# Altium schematic sheet P1.schdoc
size 594 x 421 mm; Symbol: Sheet-Symbol_A4; Company: 嘉立创EDA; Version: V1.0; Page Size: A2; @Project Name: 基于裕太微YT9215S的五口千兆交换机; @Page Count: 2; @Update Date: 2023-09-12; @Create Date: 2023-09-12; @Schematic Name: schematic1; @Page No: 1; @Page Name: P1; Device: Sheet-Symbol_A4
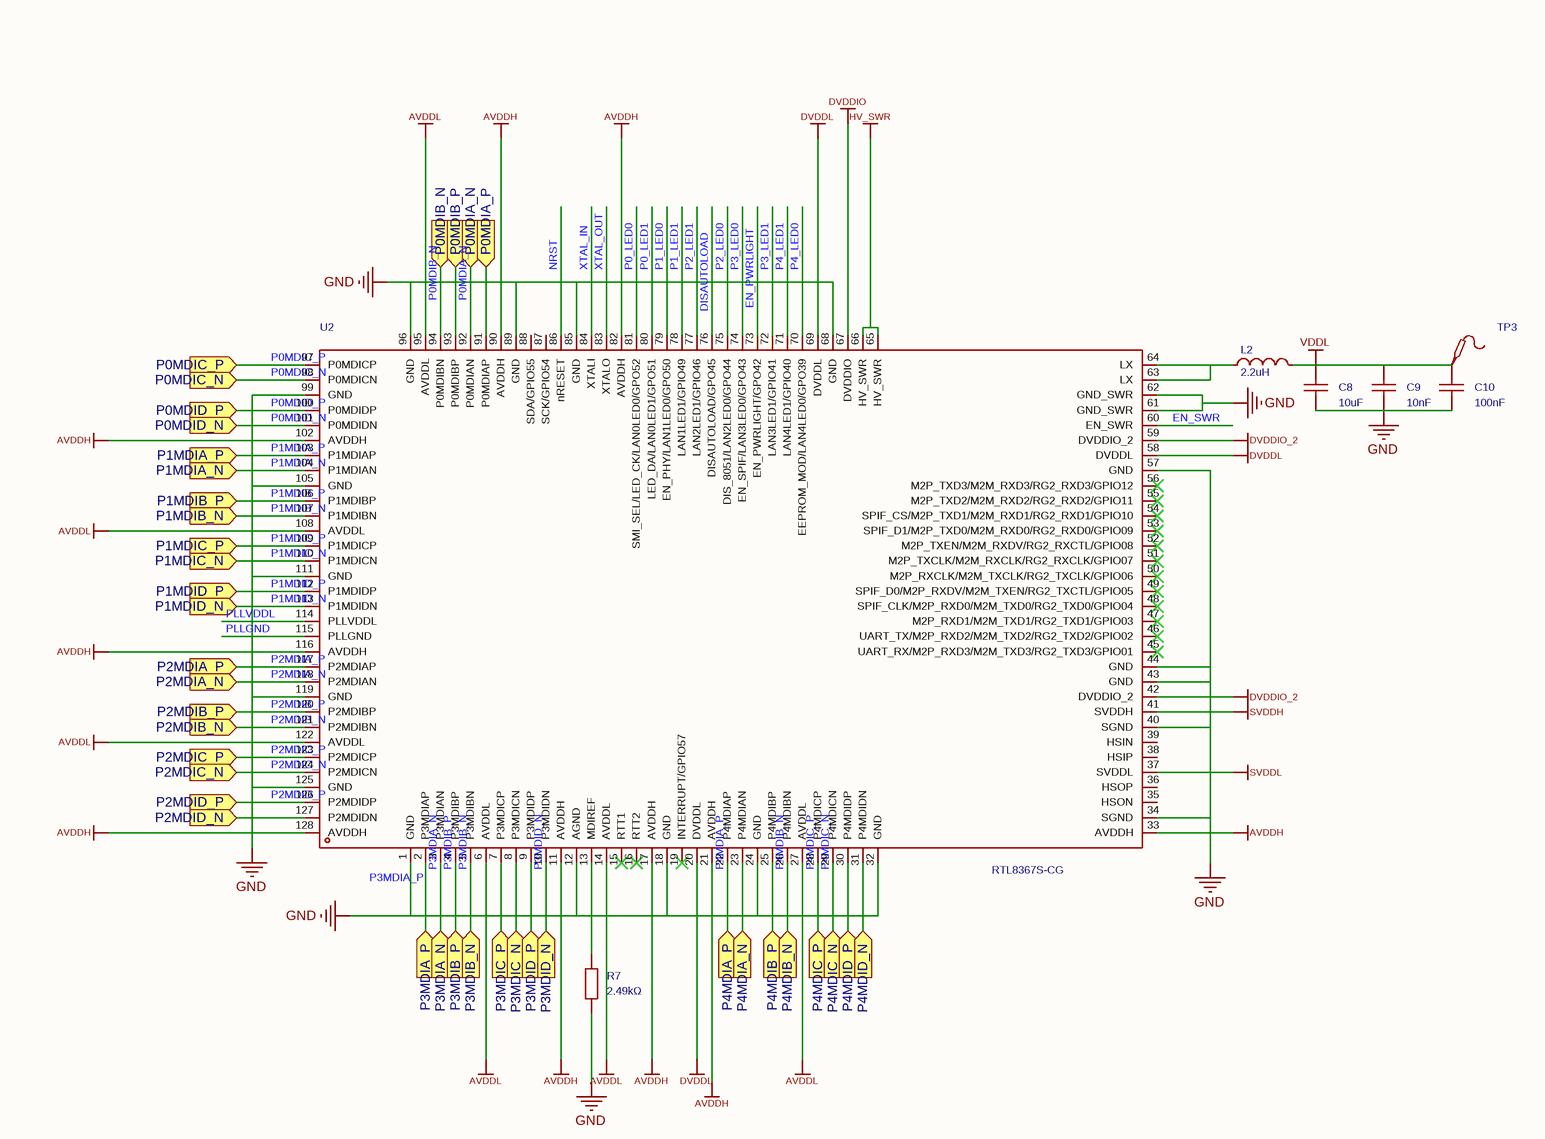
[diagram p0: P1.schdoc, top left]
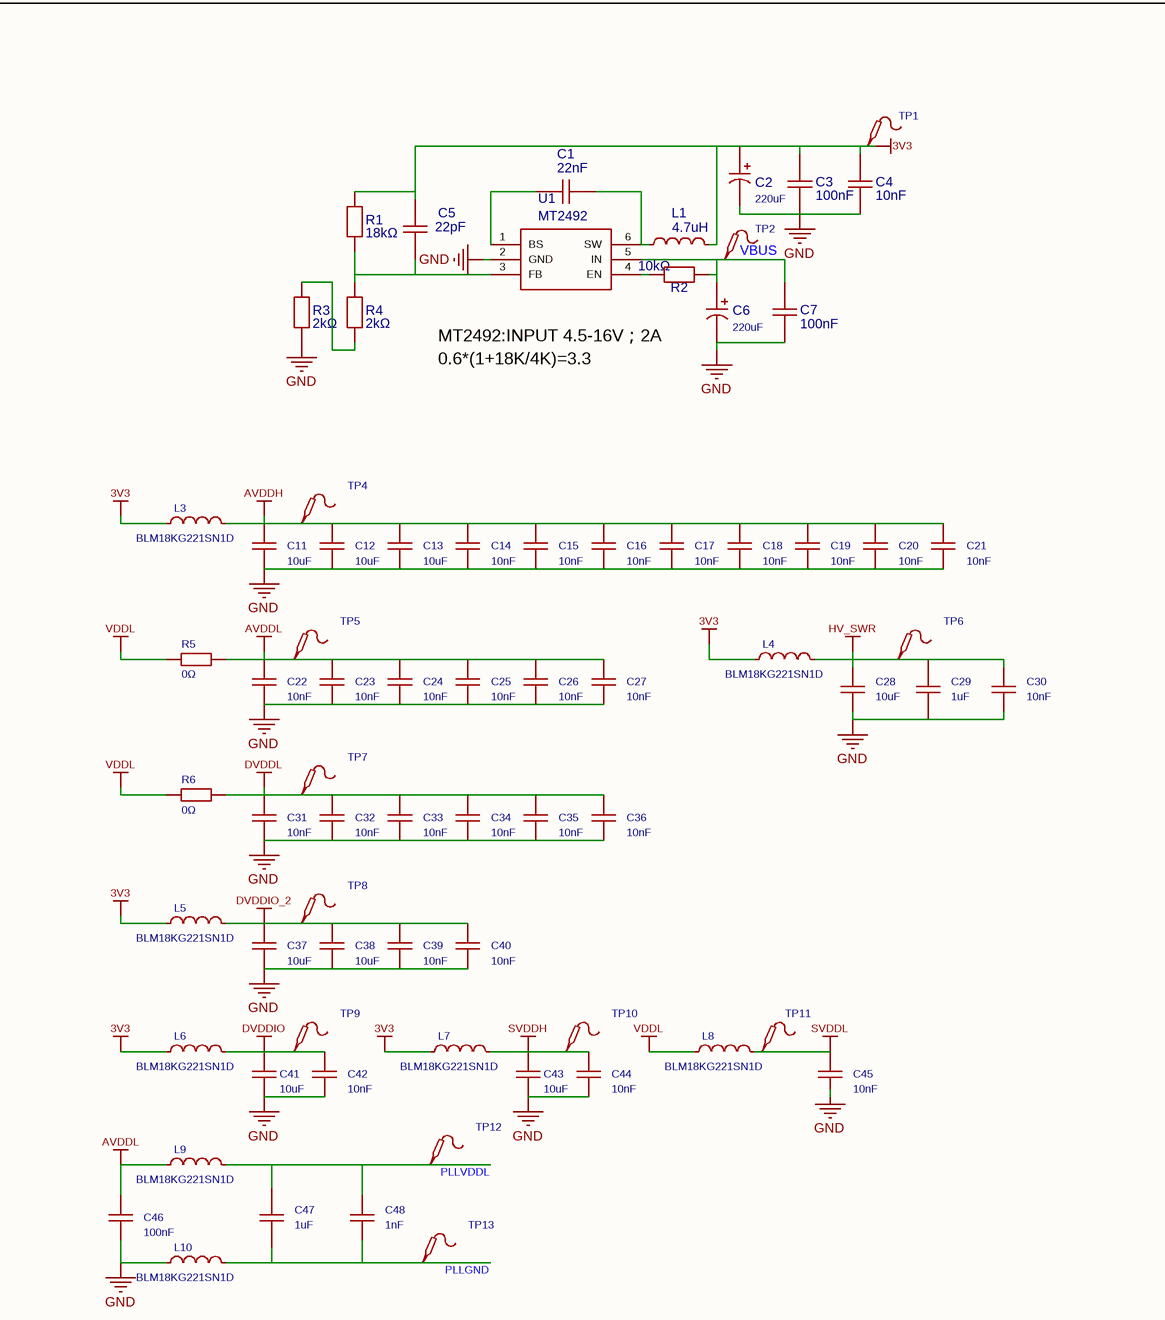
[diagram p1: P1.schdoc, top right]
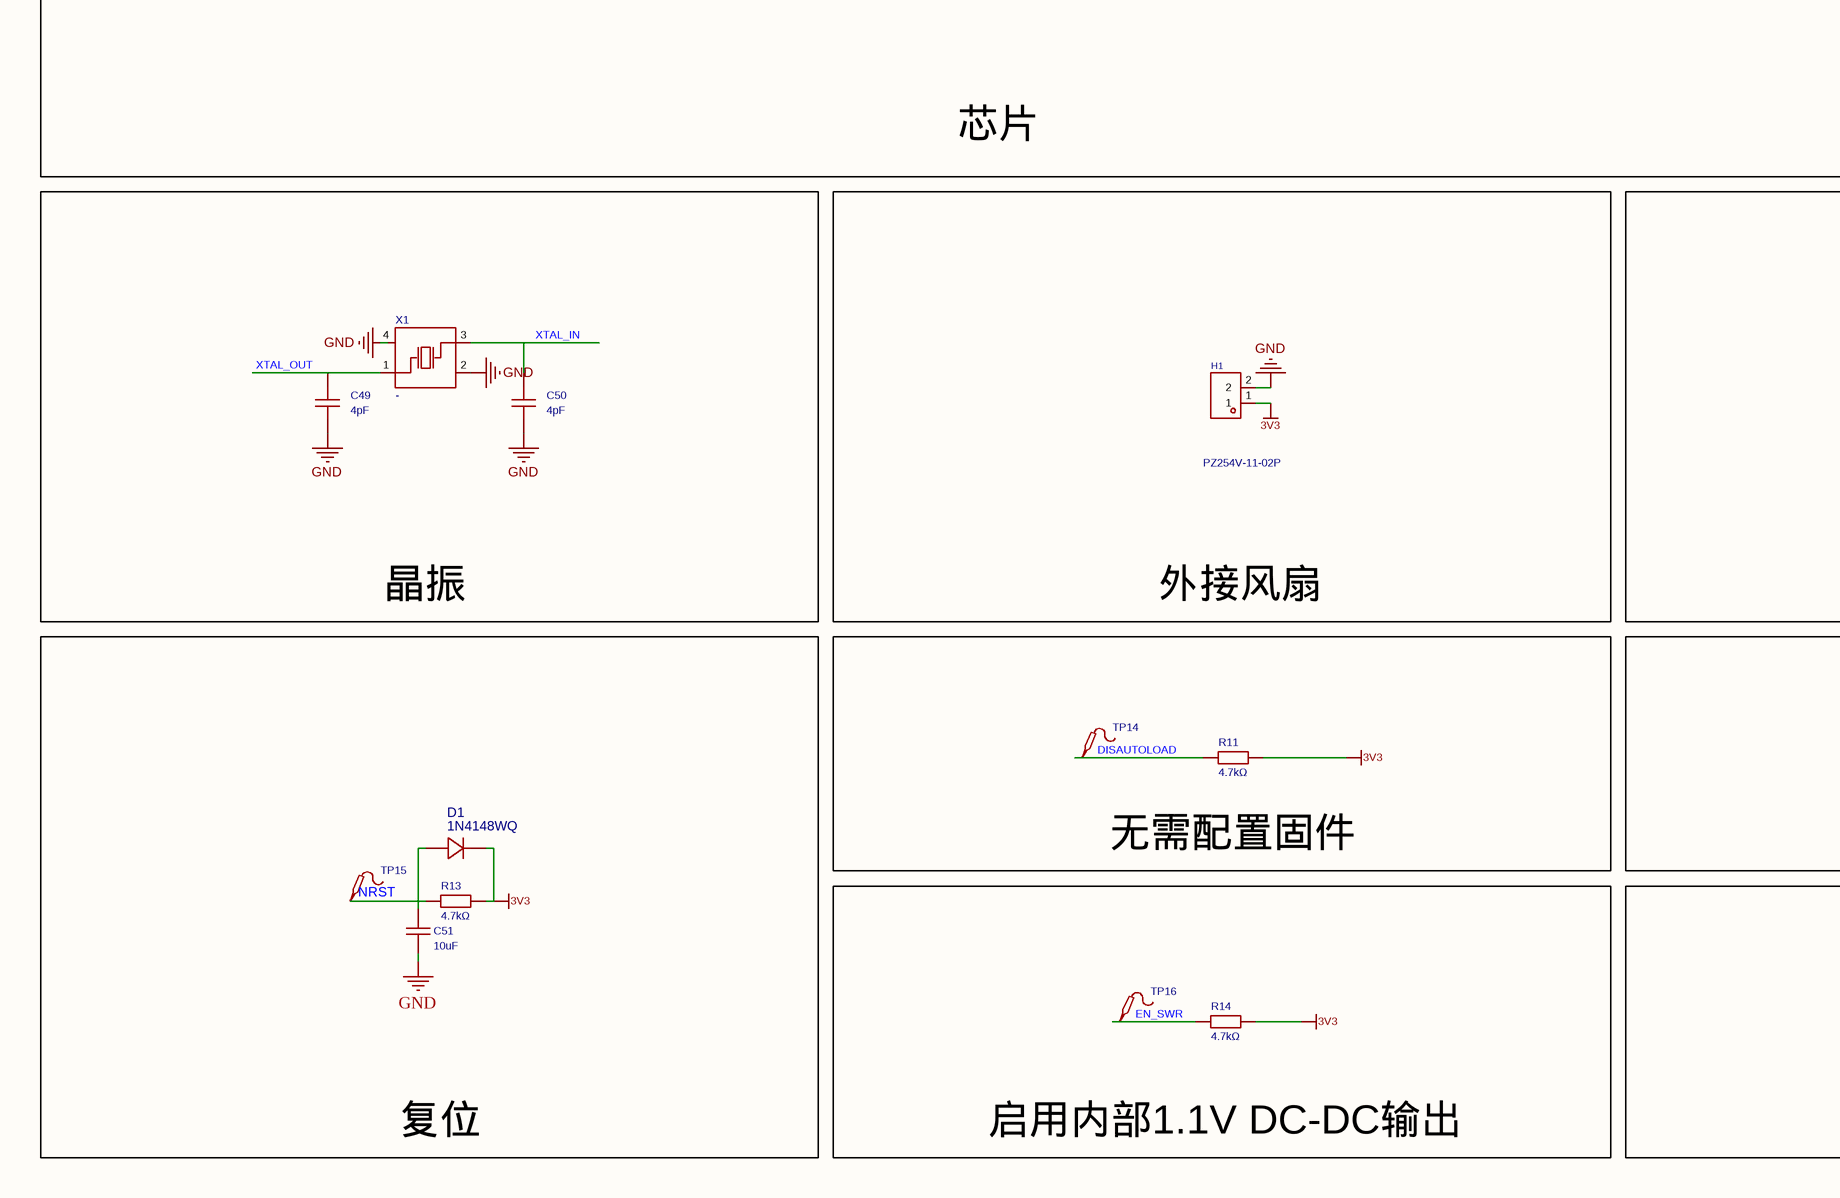
[diagram p2: P1.schdoc, bottom left]
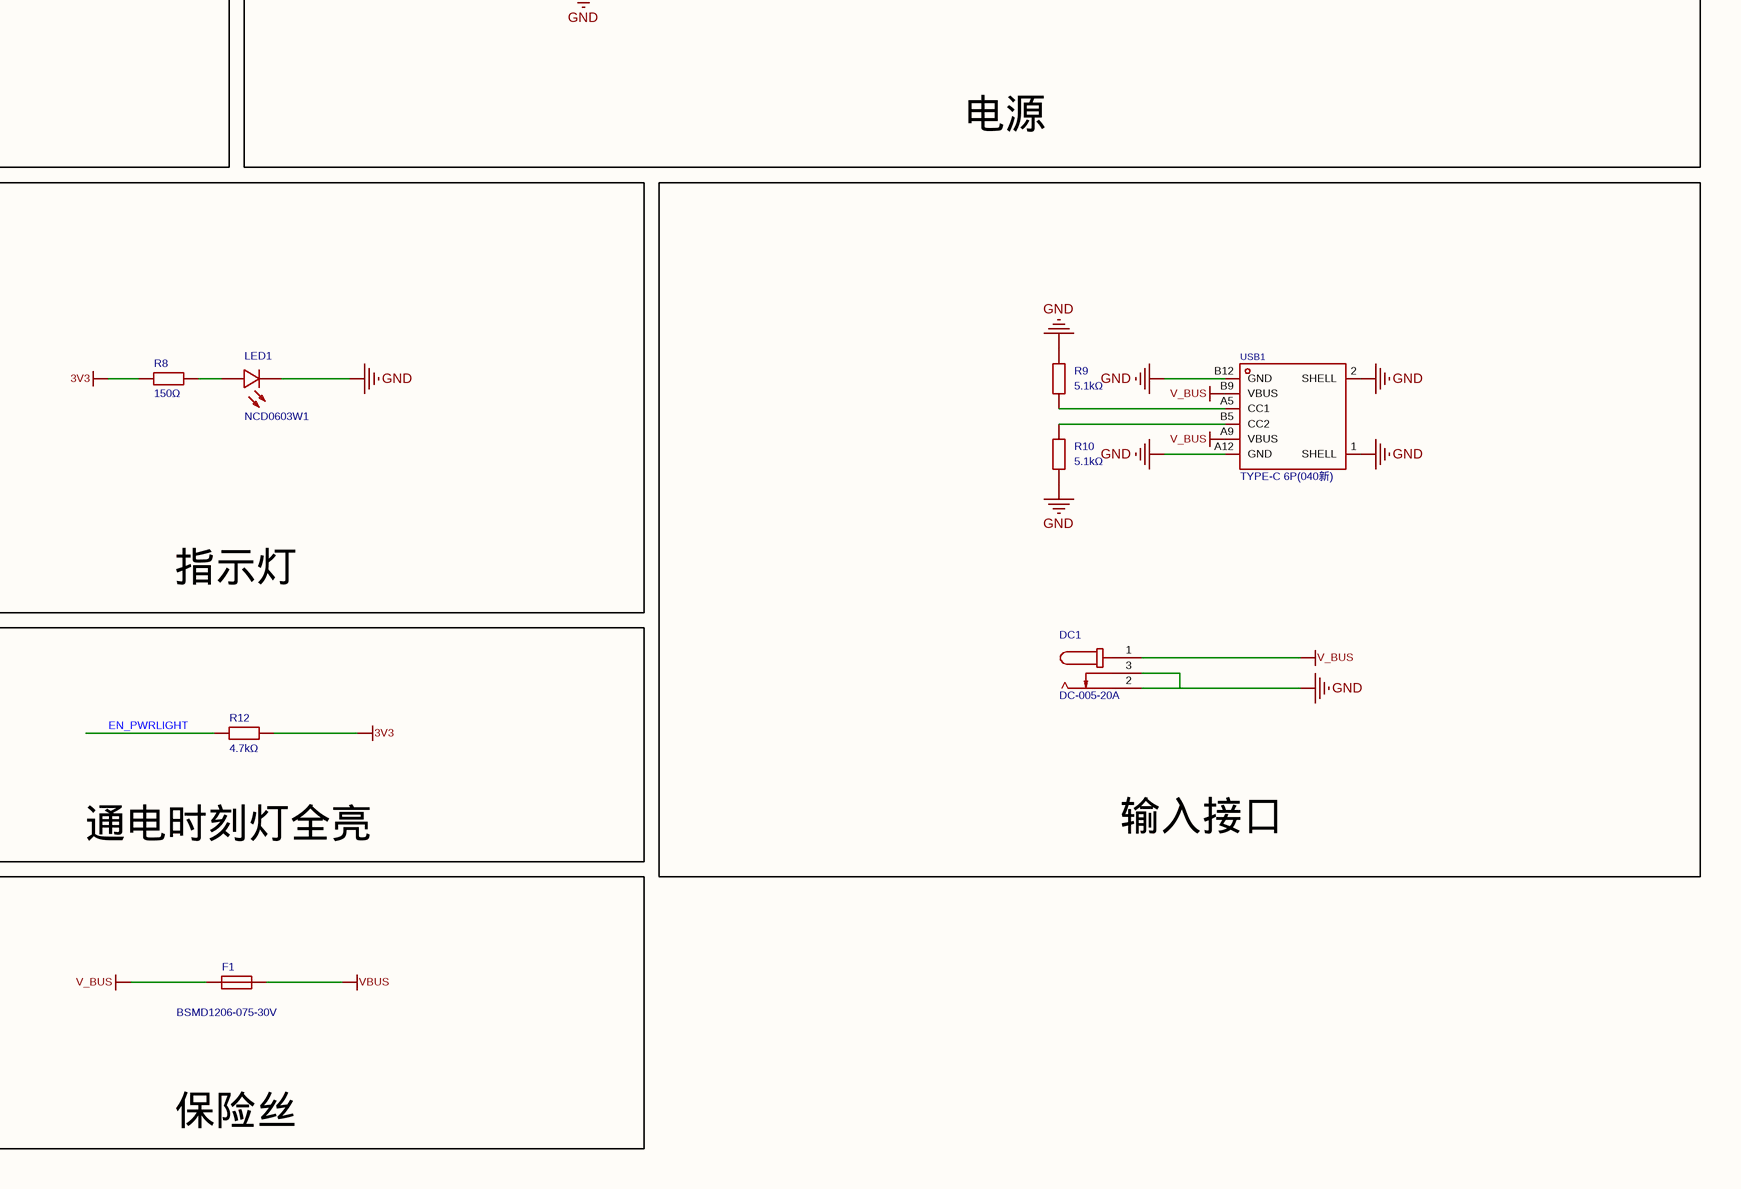
[diagram p3: P1.schdoc, bottom right]

## Parts
C1  22nF  [C0402]
C2  220uF  [CAP-SMD_BD6.3-L6.6-W6.6-LS7.4-FD]
C3  100nF  [C0402]
C4  10nF  [C0402]
C5  22pF  [C0402]
C6  220uF  [CAP-SMD_BD6.3-L6.6-W6.6-LS7.4-FD]
C7  100nF  [C0402]
C8  10uF  [C0805]
C9  10nF  [C0603]
C10  100nF  [C0603]
C11  10uF  [C0805]
C12  10uF  [C0805]
C13  10uF  [C0805]
C14  10nF  [C0603]
C15  10nF  [C0603]
C16  10nF  [C0603]
C17  10nF  [C0603]
C18  10nF  [C0603]
C19  10nF  [C0603]
C20  10nF  [C0603]
C21  10nF  [C0603]
C22  10nF  [C0603]
C23  10nF  [C0603]
C24  10nF  [C0603]
C25  10nF  [C0603]
C26  10nF  [C0603]
C27  10nF  [C0603]
C28  10uF  [C0805]
C29  1uF  [C0603]
C30  10nF  [C0603]
C31  10nF  [C0603]
C32  10nF  [C0603]
C33  10nF  [C0603]
C34  10nF  [C0603]
C35  10nF  [C0603]
C36  10nF  [C0603]
C37  10uF  [C0805]
C38  10uF  [C0805]
C39  10nF  [C0603]
C40  10nF  [C0603]
C41  10uF  [C0805]
C42  10nF  [C0603]
C43  10uF  [C0805]
C44  10nF  [C0603]
C45  10nF  [C0603]
C46  100nF  [C0603]
C47  1uF  [C0603]
C48  1nF  [C0603]
C49  4pF  [C0603]
C50  4pF  [C0603]
C51  10uF  [C0805]
D1  1N4148WQ  [SOD-123_L2.7-W1.6-LS3.7-RD-1]
DC1  DC-005-20A  [DC-IN-TH_DC-005-20A]
F1  BSMD1206-075-30V  [F1206]
H1  PZ254V-11-02P  [HDR-TH_2P-P2.54-V-M]
L1  4.7uH  [IND-SMD_L4.0-W4.0]
L2  2.2uH  [IND-SMD_L4.0-W4.0_SWPA4018S]
L3  BLM18KG221SN1D  [L0603]
L4  BLM18KG221SN1D  [L0603]
L5  BLM18KG221SN1D  [L0603]
L6  BLM18KG221SN1D  [L0603]
L7  BLM18KG221SN1D  [L0603]
L8  BLM18KG221SN1D  [L0603]
L9  BLM18KG221SN1D  [L0603]
L10  BLM18KG221SN1D  [L0603]
LED1  NCD0603W1  [LED0603-RD]
R1  18kΩ  [R0402]
R2  10kΩ  [R0402]
R3  2kΩ  [R0402]
R4  2kΩ  [R0402]
R5  0Ω  [R1206]
R6  0Ω  [R1206]
R7  2.49kΩ  [R0402]
R8  150Ω  [R0603]
R9  5.1kΩ  [R0603]
R10  5.1kΩ  [R0603]
R11  4.7kΩ  [R0603]
R12  4.7kΩ  [R0603]
R13  4.7kΩ  [R0603]
R14  4.7kΩ  [R0603]
TP1  (no value)  [Test-Point-0.5mm]
TP2  (no value)  [Test-Point-0.5mm]
TP3  (no value)  [Test-Point-0.5mm]
TP4  (no value)  [Test-Point-0.5mm]
TP5  (no value)  [Test-Point-0.5mm]
TP6  (no value)  [Test-Point-0.5mm]
TP7  (no value)  [Test-Point-0.5mm]
TP8  (no value)  [Test-Point-0.5mm]
TP9  (no value)  [Test-Point-0.5mm]
TP10  (no value)  [Test-Point-0.5mm]
TP11  (no value)  [Test-Point-0.5mm]
TP12  (no value)  [Test-Point-0.5mm]
TP13  (no value)  [Test-Point-0.5mm]
TP14  (no value)  [Test-Point-0.5mm]
TP15  (no value)  [Test-Point-0.5mm]
TP16  (no value)  [Test-Point-0.5mm]
U1  MT2492  [SOT-23-6_L2.9-W1.6-P0.95-LS2.8-BL]
U2  RTL8367S-CG  [LQFP-128_L14.0-W14.0-P0.40-LS16.0-BL]
USB1  TYPE-C 6P(040新)  [USB-C-SMD_TYPE-C-6P]
X1  -  [CRYSTAL-SMD_4P-L2.0-W1.6-BL]

## Blocks framed on the sheet
芯片: C8-C10 L2 R7 TP3 U2
电源: C1-C7 C11-C48 L1 L3-L10 R1-R6 TP1 TP2 TP4-TP13 U1
晶振: C49 C50 X1
外接风扇: H1
指示灯: LED1 R8
输入接口: DC1 R9 R10 USB1
复位: C51 D1 R13 TP15
无需配置固件: R11 TP14
通电时刻灯全亮: R12
启用内部1.1V DC-DC输出: R14 TP16
保险丝: F1

## Ports
P0MDIA_N (in), P0MDIA_P (in), P0MDIB_N (in), P0MDIB_P (in), P0MDIC_N (in), P0MDIC_P (in), P0MDID_N (in), P0MDID_P (in), P1MDIA_N (in), P1MDIA_P (in), P1MDIB_N (in), P1MDIB_P (in), P1MDIC_N (in), P1MDIC_P (in), P1MDID_N (in), P1MDID_P (in), P2MDIA_N (in), P2MDIA_P (in), P2MDIB_N (in), P2MDIB_P (in), P2MDIC_N (in), P2MDIC_P (in), P2MDID_N (in), P2MDID_P (in), P3MDIA_N (in), P3MDIA_P (in), P3MDIB_N (in), P3MDIB_P (in), P3MDIC_N (in), P3MDIC_P (in), P3MDID_N (in), P3MDID_P (in), P4MDIA_N (in), P4MDIA_P (in), P4MDIB_N (in), P4MDIB_P (in), P4MDIC_N (in), P4MDIC_P (in), P4MDID_N (in), P4MDID_P (in)

## Nets
3V3: C2.1 C3.2 C4.2 C5.1 D1.1(K) H1.1 L1.2 L3.1 L4.1 L5.1 L6.1 L7.1 R1.1 R8.1 R11.2 R12.2 R13.2 R14.2 TP1.1
AVDDH: C11.2 C12.2 C13.2 C14.2 C15.2 C16.2 C17.2 C18.2 C19.2 C20.2 C21.2 L3.2 TP4.1 U2.11(AVDDH) U2.17(AVDDH) U2.21(AVDDH) U2.33(AVDDH) U2.82(AVDDH) U2.90(AVDDH) U2.102(AVDDH) U2.116(AVDDH) U2.128(AVDDH)
AVDDL: C22.2 C23.2 C24.2 C25.2 C26.2 C27.2 C46.2 L9.1 R5.2 TP5.1 U2.6(AVDDL) U2.14(AVDDL) U2.27(AVDDL) U2.95(AVDDL) U2.108(AVDDL) U2.122(AVDDL)
DVDDIO: C41.2 C42.2 L6.2 TP9.1 U2.67(DVDDIO)
DVDDIO_2: C37.2 C38.2 C39.2 C40.2 L5.2 TP8.1 U2.42(DVDDIO_2) U2.59(DVDDIO_2)
DVDDL: C31.2 C32.2 C33.2 C34.2 C35.2 C36.2 R6.2 TP7.1 U2.20(DVDDL) U2.58(DVDDL) U2.69(DVDDL)
GND: C2.2 C3.1 C4.1 C6.2 C7.1 C8.1 C9.1 C10.1 C11.1 C12.1 C13.1 C14.1 C15.1 C16.1 C17.1 C18.1 C19.1 C20.1 C21.1 C22.1 C23.1 C24.1 C25.1 C26.1 C27.1 C28.1 C29.1 C30.1 C31.1 C32.1 C33.1 C34.1 C35.1 C36.1 C37.1 C38.1 C39.1 C40.1 C41.1 C42.1 C43.1 C44.1 C45.1 C46.1 C49.1 C50.1 C51.1 DC1.2 DC1.3 H1.2 L10.1 LED1.1(-) R3.2 R7.1 R9.2 R10.1 U1.2(GND) U2.1(GND) U2.12(AGND) U2.18(GND) U2.24(GND) U2.32(GND) U2.34(SGND) U2.40(SGND) U2.43(GND) U2.44(GND) U2.57(GND) U2.61(GND_SWR) U2.62(GND_SWR) U2.68(GND) U2.85(GND) U2.89(GND) U2.96(GND) U2.99(GND) U2.105(GND) U2.111(GND) U2.119(GND) U2.125(GND) USB1.1(SHELL) USB1.2(SHELL) USB1.A12(GND) USB1.B12(GND) X1.2(GND) X1.4(GND)
HV_SWR: C28.2 C29.2 C30.2 L4.2 TP6.1 U2.65(HV_SWR) U2.66(HV_SWR)
SVDDH: C43.2 C44.2 L7.2 TP10.1 U2.41(SVDDH)
SVDDL: C45.2 L8.2 TP11.1 U2.37(SVDDL)
V_BUS: DC1.1 F1.1 USB1.A9(VBUS) USB1.B9(VBUS)
VBUS: C6.1 C7.2 F1.2 R2.1 TP2.1 U1.5(IN)
VDDL: C8.2 C9.2 C10.2 L2.2 L8.1 R5.1 R6.1 TP3.1
DISAUTOLOAD: R11.1 TP14.1 U2.76(DISAUTOLOAD/GPO45)
EN_PWRLIGHT: R12.1 U2.73(EN_PWRLIGHT/GPO42)
EN_SWR: R14.1 TP16.1 U2.60(EN_SWR)
NRST: C51.2 D1.2(A) R13.1 TP15.1 U2.86(nRESET)
P0_LED0: U2.81(SMI_SEL/LED_CK/LAN0LED0/GPO52)
P0_LED1: U2.80(LED_DA/LAN0LED1/GPO51)
P0MDIA_N: U2.92(P0MDIAN) ; port P0MDIA_N
P0MDIA_P: U2.91(P0MDIAP) ; port P0MDIA_P
P0MDIB_N: U2.94(P0MDIBN) ; port P0MDIB_N
P0MDIB_P: U2.93(P0MDIBP) ; port P0MDIB_P
P0MDIC_N: U2.98(P0MDICN) ; port P0MDIC_N
P0MDIC_P: U2.97(P0MDICP) ; port P0MDIC_P
P0MDID_N: U2.101(P0MDIDN) ; port P0MDID_N
P0MDID_P: U2.100(P0MDIDP) ; port P0MDID_P
P1_LED0: U2.79(EN_PHY/LAN1LED0/GPO50)
P1_LED1: U2.78(LAN1LED1/GPIO49)
P1MDIA_N: U2.104(P1MDIAN) ; port P1MDIA_N
P1MDIA_P: U2.103(P1MDIAP) ; port P1MDIA_P
P1MDIB_N: U2.107(P1MDIBN) ; port P1MDIB_N
P1MDIB_P: U2.106(P1MDIBP) ; port P1MDIB_P
P1MDIC_N: U2.110(P1MDICN) ; port P1MDIC_N
P1MDIC_P: U2.109(P1MDICP) ; port P1MDIC_P
P1MDID_N: U2.113(P1MDIDN) ; port P1MDID_N
P1MDID_P: U2.112(P1MDIDP) ; port P1MDID_P
P2_LED0: U2.75(DIS_8051/LAN2LED0/GPO44)
P2_LED1: U2.77(LAN2LED1/GPIO46)
P2MDIA_N: U2.118(P2MDIAN) ; port P2MDIA_N
P2MDIA_P: U2.117(P2MDIAP) ; port P2MDIA_P
P2MDIB_N: U2.121(P2MDIBN) ; port P2MDIB_N
P2MDIB_P: U2.120(P2MDIBP) ; port P2MDIB_P
P2MDIC_N: U2.124(P2MDICN) ; port P2MDIC_N
P2MDIC_P: U2.123(P2MDICP) ; port P2MDIC_P
P2MDID_N: U2.127(P2MDIDN) ; port P2MDID_N
P2MDID_P: U2.126(P2MDIDP) ; port P2MDID_P
P3_LED0: U2.74(EN_SPIF/LAN3LED0/GPO43)
P3_LED1: U2.72(LAN3LED1/GPIO41)
P3MDIA_N: U2.3(P3MDIAN) ; port P3MDIA_N
P3MDIA_P: U2.2(P3MDIAP) ; port P3MDIA_P
P3MDIB_N: U2.5(P3MDIBN) ; port P3MDIB_N
P3MDIB_P: U2.4(P3MDIBP) ; port P3MDIB_P
P3MDIC_N: U2.8(P3MDICN) ; port P3MDIC_N
P3MDIC_P: U2.7(P3MDICP) ; port P3MDIC_P
P3MDID_N: U2.10(P3MDIDN) ; port P3MDID_N
P3MDID_P: U2.9(P3MDIDP) ; port P3MDID_P
P4_LED0: U2.70(EEPROM_MOD/LAN4LED0/GPO39)
P4_LED1: U2.71(LAN4LED1/GPIO40)
P4MDIA_N: U2.23(P4MDIAN) ; port P4MDIA_N
P4MDIA_P: U2.22(P4MDIAP) ; port P4MDIA_P
P4MDIB_N: U2.26(P4MDIBN) ; port P4MDIB_N
P4MDIB_P: U2.25(P4MDIBP) ; port P4MDIB_P
P4MDIC_N: U2.29(P4MDICN) ; port P4MDIC_N
P4MDIC_P: U2.28(P4MDICP) ; port P4MDIC_P
P4MDID_N: U2.31(P4MDIDN) ; port P4MDID_N
P4MDID_P: U2.30(P4MDIDP) ; port P4MDID_P
PLLGND: C47.1 C48.1 L10.2 TP13.1 U2.115(PLLGND)
PLLVDDL: C47.2 C48.2 L9.2 TP12.1 U2.114(PLLVDDL)
XTAL_IN: C50.2 U2.84(XTALI) X1.3(OSC2)
XTAL_OUT: C49.2 U2.83(XTALO) X1.1(OSC1)
NetC1_1: C1.1 U1.1(BS)
NetC1_2: C1.2 L1.1 U1.6(SW)
NetC5_2: C5.2 R1.2 R4.1 U1.3(FB)
NetL2_1: L2.1 U2.63(LX) U2.64(LX)
NetLED1_2: LED1.2(+) R8.2
NetR2_2: R2.2 U1.4(EN)
NetR3_1: R3.1 R4.2
NetR7_2: R7.2 U2.13(MDIREF)
NetR9_1: R9.1 USB1.A5(CC1)
NetR10_2: R10.2 USB1.B5(CC2)

Not connected (* = marked no-connect by the designer): U2 15(RTT1)* 16(RTT2)* 19(INTERRUPT/GPIO57)* 35(HSON) 36(HSOP) 38(HSIP) 39(HSIN) 45(UART_RX/M2P_RXD3/M2M_TXD3/RG2_TXD3/GPIO01)* 46(UART_TX/M2P_RXD2/M2M_TXD2/RG2_TXD2/GPIO02)* 47(M2P_RXD1/M2M_TXD1/RG2_TXD1/GPIO03)* 48(SPIF_CLK/M2P_RXD0/M2M_TXD0/RG2_TXD0/GPIO04)* 49(SPIF_D0/M2P_RXDV/M2M_TXEN/RG2_TXCTL/GPIO05)* 50(M2P_RXCLK/M2M_TXCLK/RG2_TXCLK/GPIO06)* 51(M2P_TXCLK/M2M_RXCLK/RG2_RXCLK/GPIO07)* 52(M2P_TXEN/M2M_RXDV/RG2_RXCTL/GPIO08)* 53(SPIF_D1/M2P_TXD0/M2M_RXD0/RG2_RXD0/GPIO09)* 54(SPIF_CS/M2P_TXD1/M2M_RXD1/RG2_RXD1/GPIO10)* 55(M2P_TXD2/M2M_RXD2/RG2_RXD2/GPIO11)* 56(M2P_TXD3/M2M_RXD3/RG2_RXD3/GPIO12)* 87(SCK/GPIO54) 88(SDA/GPIO55)

## Notes on the sheet
- 0.6*(1+18K/4K)=3.3
- MT2492:INPUT 4.5-16V；2A
- 更新日期
- 2023-09-12
- 原理图
- 图页
- schematic1
- P1
- 创建日期
- 物料编码
- 审阅
- 绘制
- 基于裕太微YT9215S的五口千兆交换机
- 版本
- V1.0
- 尺寸
- A2
- 页
- 1
- 嘉立创EDA
- 共
- 2

## Library data of the parts
C1 = 0402B223K500NT: 容值:22nF;精度:±10%;额定电压:50V;材质(温度系数):X7R;; Manufacturer: FH(风华); Origin Footprint: C0402_NEW; Convert to PCB: yes; ModelId: 36a51122f27c49738f86b3bfa98863e0; ModelName: C0402_L1.0-W0.5-H0.5; ModelTransform: 39.37,19.685,0,0,0,0,0,0,0; Tolerance: ±10%; Voltage Rated: 50V; Temperature Coefficient: X7R; Device: 0402B223K500NT; Symbol: 22nf; Supplier Part: C1532; Supplier: LCSC; Manufacturer Part: 0402B223K500NT; Add into BOM: yes; LCSC Part Name: 22nF ±10% 50V; Supplier Footprint: 0402; JLCPCB Part Class: Basic Part; Datasheet: https://atta.szlcsc.com/upload/public/pdf/source/20200305/C486355_26A10D38EF8C2A5C37091D0039909270.pdf; FootprintName: C0402; Value: 22nF
C2 C6 = RVT1E221M0607: 容值:220uF;精度:±20%;额定电压:25V;纹波电流:150mA@120Hz;等效串联电阻:-;; Manufacturer: ROQANG(容强); Symbol: RVT1E221M0607_C2918361; AddInBom: yes; ModelId: 1416614ffc1f4b92814ec0fcf834cf2d; ModelTransform: 291.338,259.842,0,180,0,0,-0.004,-0.007,0; Tolerance: ±20%; Rated Voltage: 25V; φD: 6.3mm; L: 7.7mm; Device: RVT1E221M0607; Supplier: LCSC; Supplier Part: C2918361; Manufacturer Part: RVT1E221M0607; Value: 220uF; JLCPCB Part Class: 扩展库; LCSC Part Name: 220uF ±20% 25V; Supplier Footprint: SMD,D6.3xL7.7mm; Datasheet: https://atta.szlcsc.com/upload/public/pdf/source/20211118/497C0614266278696CA52BDF245B991F.pdf; ConvertToPcb: yes; FootprintName: CAP-SMD_BD6.3-L6.6-W6.6-LS7.4-FD; ModelName: CAP-SMD_BD6.3-L6.6-W6.6-LS7.4-FD; Ripple Current: 150mA@120Hz; Equivalent Series Resistance(ESR): -; Lifetime @ Temp: -; Operating Temperature: -40℃~+105℃
C3 C7 = CL05B104KO5NNNC: 容值:100nF;精度:±10%;额定电压:16V;材质(温度系数):X7R;; Manufacturer: SAMSUNG(三星); Origin Footprint: C0402_NEW; Symbol: 0.1uf; Convert to PCB: yes; ModelId: 36a51122f27c49738f86b3bfa98863e0; ModelName: C0402_L1.0-W0.5-H0.5; ModelTransform: 39.37,19.685,0,0,0,0,0,0,0; Tolerance: ±10%; Voltage Rated: 16V; Temperature Coefficient: X7R; Device: CL05B104KO5NNNC; Supplier Part: C1525; Supplier: LCSC; Manufacturer Part: CL05B104KO5NNNC; Add into BOM: yes; LCSC Part Name: 100nF ±10% 16V; Supplier Footprint: 0402; JLCPCB Part Class: Basic Part; Datasheet: https://atta.szlcsc.com/upload/public/pdf/source/20160103/1457707674891.pdf; FootprintName: C0402; Value: 100nF
C4 = CL05B103KB5NNNC: 容值:10nF;精度:±10%;额定电压:50V;材质(温度系数):X7R;; Manufacturer: SAMSUNG(三星); Origin Footprint: C0402_NEW; Convert to PCB: yes; ModelId: 36a51122f27c49738f86b3bfa98863e0; ModelName: C0402_L1.0-W0.5-H0.5; ModelTransform: 39.37,19.685,0,0,0,0,0,0,0; Tolerance: ±10%; Voltage Rated: 50V; Temperature Coefficient: X7R; Device: CL05B103KB5NNNC; Symbol: 10nf; Supplier Part: C15195; Supplier: LCSC; Manufacturer Part: CL05B103KB5NNNC; Add into BOM: yes; LCSC Part Name: 10nF ±10% 50V; Supplier Footprint: 0402; JLCPCB Part Class: Basic Part; Datasheet: https://atta.szlcsc.com/upload/public/pdf/source/20160103/1457707674468.pdf; FootprintName: C0402; Value: 10nF
C5 = 0402CG220J500NT: 容值:22pF;精度:±5%;额定电压:50V;材质(温度系数):C0G;; Manufacturer: FH(风华); Origin Footprint: C0402_NEW; Convert to PCB: yes; ModelId: 36a51122f27c49738f86b3bfa98863e0; ModelName: C0402_L1.0-W0.5-H0.5; ModelTransform: 39.37,19.685,0,0,0,0,0,0,0; Tolerance: ±5%; Voltage Rated: 50V; Temperature Coefficient: C0G; Device: 0402CG220J500NT; Symbol: 22pf; Supplier Part: C1555; Supplier: LCSC; Manufacturer Part: 0402CG220J500NT; Add into BOM: yes; LCSC Part Name: 22pF ±5% 50V; Supplier Footprint: 0402; JLCPCB Part Class: Basic Part; Datasheet: https://atta.szlcsc.com/upload/public/pdf/source/20200305/C486355_26A10D38EF8C2A5C37091D0039909270.pdf; FootprintName: C0402; Value: 22pF
C8 C11-C13 C28 C37 C38 C41 C43 C51 = 0805X106K250NT: 容值:10uF;精度:±10%;额定电压:25V;材质(温度系数):X5R;; Manufacturer: FH(风华); AddInBom: yes; ModelId: 1ba041120af144c991958decab20d241; ModelName: C0805_L2.0-W1.3-H1.3; ModelTransform: 78.74,51.181,0,0,0,0,0,0.0005,0; Tolerance: ±10%; Voltage Rated: 25V; Temperature Coefficient: X5R; Symbol: 0805X106K250NT; Device: 0805X106K250NT; LCSC Part Name: 10uF ±10% 25V; SupplierPart: C40894; ManufacturerPart: 0805X106K250NT; Supplier Footprint: 0805; JLCPCB Part Class: 扩展库; Datasheet: https://atta.szlcsc.com/upload/public/pdf/source/20170923/C40894_1506149452994988759.pdf; Supplier: LCSC; ConvertToPcb: yes; FootprintName: C0805; Value: 10uF
C9 C14-C27 C30-C36 C39 C40 C42 C44 C45 = 0603B103K500NT: 容值:10nF;精度:±10%;额定电压:50V;材质(温度系数):X7R;; Manufacturer: FH(风华); AddInBom: yes; ModelId: ac125912035d415993ca9572d50418b1; ModelName: C0603_L1.6-W0.8-H0.8; ModelTransform: 62.992,31.496,0,0,0,0,0,0,0; Tolerance: ±10%; Voltage Rated: 50V; Temperature Coefficient: X7R; Symbol: 0603B103K500NT; Device: 0603B103K500NT; LCSC Part Name: 10nF ±10% 50V; SupplierPart: C57112; ManufacturerPart: 0603B103K500NT; Supplier Footprint: 0603; JLCPCB Part Class: 基础库; Datasheet: https://atta.szlcsc.com/upload/public/pdf/source/20170923/C57112_1506149495135988846.pdf; Supplier: LCSC; ConvertToPcb: yes; FootprintName: C0603; Value: 10nF
C10 C46 = 0603B104K500NT: 容值:100nF;精度:±10%;额定电压:50V;材质(温度系数):X7R;; Manufacturer: FH(风华); AddInBom: yes; ModelId: ac125912035d415993ca9572d50418b1; ModelName: C0603_L1.6-W0.8-H0.8; ModelTransform: 62.992,31.496,0,0,0,0,0,0,0; Tolerance: ±10%; Voltage Rated: 50V; Temperature Coefficient: X7R; Symbol: 0603B104K500NT; Device: 0603B104K500NT; LCSC Part Name: 100nF ±10% 50V; SupplierPart: C30926; ManufacturerPart: 0603B104K500NT; Supplier Footprint: 0603; JLCPCB Part Class: 扩展库; Datasheet: https://atta.szlcsc.com/upload/public/pdf/source/20170923/C30926_1506149436298988724.pdf; Supplier: LCSC; ConvertToPcb: yes; FootprintName: C0603; Value: 100nF
C29 C47 = 0603B105K500NT: 温度系数:X7R;精度:±10%;额定电压:50V;容值:1uF;; Manufacturer: FH(风华); AddInBom: yes; ModelId: ac125912035d415993ca9572d50418b1; ModelName: C0603_L1.6-W0.8-H0.8; ModelTransform: 62.992,31.496,0,0,0,0,0,0,0; Temperature Coefficient: X7R; Tolerance: ±10%; Voltage Rated: 50V; Symbol: 0603B105K500NT; Device: 0603B105K500NT; LCSC Part Name: 1uF(105) ±10% 50V; SupplierPart: C90540; ManufacturerPart: 0603B105K500NT; Supplier Footprint: 0603; JLCPCB Part Class: 扩展库; Datasheet: https://atta.szlcsc.com/upload/public/pdf/source/20170923/C90540_1506149560830988967.pdf; Supplier: LCSC; ConvertToPcb: yes; FootprintName: C0603; Value: 1uF
C48 = 0603B102K500NT: 容值:1nF;精度:±10%;额定电压:50V;材质(温度系数):X7R;; Manufacturer: FH(风华); AddInBom: yes; ModelId: ac125912035d415993ca9572d50418b1; ModelName: C0603_L1.6-W0.8-H0.8; ModelTransform: 62.992,31.496,0,0,0,0,0,0,0; Tolerance: ±10%; Voltage Rated: 50V; Temperature Coefficient: X7R; Symbol: 0603B102K500NT; Device: 0603B102K500NT; LCSC Part Name: 1nF ±10% 50V; SupplierPart: C44369; ManufacturerPart: 0603B102K500NT; Supplier Footprint: 0603; JLCPCB Part Class: 扩展库; Datasheet: https://atta.szlcsc.com/upload/public/pdf/source/20170923/C44369_1506149462708988780.pdf; Supplier: LCSC; ConvertToPcb: yes; FootprintName: C0603; Value: 1nF
C49 C50 = 0603CG4R0B500NT: 容值:4pF;额定电压:50V;材质(温度系数):C0G;; Manufacturer: FH(风华); AddInBom: yes; ModelId: ac125912035d415993ca9572d50418b1; ModelName: C0603_L1.6-W0.8-H0.8; ModelTransform: 62.992,31.496,0,0,0,0,0,0,0; Voltage Rated: 50V; Temperature Coefficient: C0G; Symbol: 0603CG4R0B500NT; Device: 0603CG4R0B500NT; LCSC Part Name: 4pF 50V ±0.1pF; SupplierPart: C507053; ManufacturerPart: 0603CG4R0B500NT; Supplier Footprint: 0603; JLCPCB Part Class: 扩展库; Datasheet: https://atta.szlcsc.com/upload/public/pdf/source/20200305/C486355_26A10D38EF8C2A5C37091D0039909270.pdf; Supplier: LCSC; ConvertToPcb: yes; FootprintName: C0603; Value: 4pF
D1 = 1N4148WQ: Manufacturer: YANGJIE(扬杰); Symbol: 1N4148; Convert to PCB: yes; ModelId: 528459655f7d4601a76356f3191c812b; ModelTransform: 151.575,66.929,0,0,0,0,0,0,0; Origin Footprint: SOD-123_L2.7-W1.6-LS3.7-RD-1; Device: 1N4148WQ; Supplier: LCSC; Supplier Part: C2942441; Manufacturer Part: 1N4148WQ; JLCPCB Part Class: Extended Part; Add into BOM: yes; LCSC Part Name: 车规级; Supplier Footprint: SOD-123; Datasheet: https://atta.szlcsc.com/upload/public/pdf/source/20220505/FBE89F3A747E9227B0A9D8340B8A7F4C.pdf; FootprintName: SOD-123_L2.7-W1.6-LS3.7-RD-1; ModelName: SOD-123_L2.7-W1.6-LS3.7-RD-1
DC1 = DC-005-20A_C136744: 触点内径:2mm;触点外径:6.4mm;额定电流:500mA;额定电压:30V;; Manufacturer: 韩国韩荣; AddInBom: yes; ModelId: a72b9ca70a994526b1ddd7443b6051df; ModelTransform: 366.141,555.117,0,270,0,0,-135.827,83.661,-161.417; Inside Contact Diameter: 2mm; Outside Contact Diameter: 6.4mm; Current Rating (Max): 500mA; Voltage Rating (Max): 30V; Symbol: DC-005-20A_C136744; Device: DC-005-20A_C136744; LCSC Part Name: DC-005-20A  内芯2.0mm 全铜; SupplierPart: C136744; ManufacturerPart: DC-005-20A; Supplier Footprint: 插件; JLCPCB Part Class: 扩展库; Datasheet: https://atta.szlcsc.com/upload/public/pdf/source/20210810/D1FE451D887B1804F0660F580C4AD849.pdf; Supplier: LCSC; ConvertToPcb: yes; FootprintName: DC-IN-TH_DC-005-20A; ModelName: DC-IN-TH_DC-005-20A
F1 = BSMD1206-075-30V: 最大电压:30V;最大电流:40A;保持电流:750mA;跳闸电流:1.5A;消耗功率:600mW;初始态阻值(最小值):90mΩ;跳断后阻值(最大值):500mΩ;最大动作时间:200ms;工作温度:-40℃~+85℃;; Manufacturer: BHFUSE(佰宏); AddInBom: yes; ModelId: f1628daad26847a79b887277a2bc8541; ModelName: F1206_L3.2-W1.7-H0.6; ModelTransform: 125.984,66.929,0,0,0,0,0,0,0; Operating Voltage (Max): 30V; Current Rating (Max): 40A; Hold Current: 750mA; Trip Current: 1.5A; Power Dissipation: 600mW; Resistance - Initial (Ri) (Min): 90mΩ; Resistance - Post Trip (R1) (Max): 500mΩ; Maximum Time to Trip: 200ms; Symbol: BSMD1206-075-30V; Device: BSMD1206-075-30V; LCSC Part Name: 1206 0.75A 30V 佰宏高电压; SupplierPart: C976305; ManufacturerPart: BSMD1206-075-30V; Supplier Footprint: 1206; JLCPCB Part Class: 扩展库; Datasheet: https://atta.szlcsc.com/upload/public/pdf/source/20220607/BE3D288249A8A8FEF08AA69BF9FC830E.pdf; Supplier: LCSC; ConvertToPcb: yes; FootprintName: F1206; Operating Temperature: -40℃~+85℃
H1 = PZ254V-11-02P: 排数:单排;总PIN位数:2P;间距:2.54mm;插针结构:1x2P;行距:-;安装类型:直插;圆针/方针:方针;额定电流:-;额定电压:-;配合针长度:6mm;塑高:2.5mm;端接针长度:3mm;触头材质:黄铜;触头镀层:-;工作温度范围:-40℃~+105℃;颜色:黑色;; Manufacturer: XFCN(兴飞); AddInBom: yes; ModelId: e35305ec3aa84b66b849f914b715e73f; ModelName: HDR2.54-M-LI-1X2P; ModelTransform: 200,100,0,0,0,0,0,0,-118.11; Pitch: 2.54mm; Pin Structure: 1x2P; Circluar Pins/Square Pins: 方针; Symbol: PZ254V-11-02P; Device: PZ254V-11-02P; Supplier: LCSC; Supplier Part: C492401; Manufacturer Part: PZ254V-11-02P; JLCPCB Part Class: 扩展库; LCSC Part Name: 2.54mm 1x2P 直插 方针; Supplier Footprint: 插件,P=2.54mm; Datasheet: https://atta.szlcsc.com/upload/public/pdf/source/20200309/C492401_A812433581A9B211A7FFA413ADDFF0E5.pdf; ConvertToPcb: yes; FootprintName: HDR-TH_2P-P2.54-V-M; Number of Rows: 单排; Number of Pins: 2P; Row Spacing: -; Mounting Type: 直插; Current Rating (Max): -; Voltage Rating (Max): -; Length of Mating Pin: 6mm; Insulation Height: 2.5mm; Length of End Connection Pin: 3mm; Contact Material: 黄铜; Contact Plating: -; Operating Temperature Range: -40℃~+105℃; Color: 黑色
L1 = SWPA4030S4R7MT: 直流电阻(DCR):78mΩ;精度:±20%;电感值:4.7uH;额定电流:2A;; Manufacturer: Sunlord(顺络); Convert to PCB: yes; ModelId: 45bc3737ecfd4f3bb122605ee525b018; ModelName: IND-SMD_L4.0-W4.0-H1.9; ModelTransform: 157.48,158.267,0,90,0,0,0,0,0; DC Resistance (DCR): 78mΩ; Tolerance: ±20%; Rated Current: 2A; Origin Footprint: IND-SMD_L4.0-W4.0; Device: SWPA4030S4R7MT; Symbol: 4.7uH; Supplier: LCSC; Supplier Part: C57269; Manufacturer Part: SWPA4030S4R7MT; Add into BOM: yes; LCSC Part Name: 4.7uH ±20%; Supplier Footprint: SMD; JLCPCB Part Class: Extended Part; Datasheet: https://atta.szlcsc.com/upload/public/pdf/source/20161024/1477287957557.pdf; FootprintName: IND-SMD_L4.0-W4.0; Height: 3mm; Value: 4.7uH; Width: 4mm; Length: 4mm
L2 = SWPA4018S2R2MT: 类型:-;电感值:2.2uH;精度:±20%;额定电流:1.65A;饱和电流(Isat):3.2A;; Manufacturer: Sunlord(顺络); AddInBom: yes; ModelId: a0312046766d423b9f3ce3b362dc752d; ModelName: IND-SMD_L4.0-W4.0-H3.0; ModelTransform: 157.48,158.267,0,90,0,0,0,0,0; Tolerance: ±20%; Rated Current: 1.65A; Saturation Current (Isat): 3.2A; DC Resistance (DCR): 45mΩ; Symbol: SWPA4018S2R2MT; Device: SWPA4018S2R2MT; LCSC Part Name: 2.2uH ±20% 3.2A; SupplierPart: C50543; ManufacturerPart: SWPA4018S2R2MT; Supplier Footprint: SMD; JLCPCB Part Class: 扩展库; Datasheet: https://atta.szlcsc.com/upload/public/pdf/source/20210916/AC798BA7E846B7D0B6818F45CD84DB0B.pdf; Supplier: LCSC; ConvertToPcb: yes; FootprintName: IND-SMD_L4.0-W4.0_SWPA4018S; Type: -; Value: 2.2uH; Ratings: -
L3-L10 = BLM18KG221SN1D: 标称阻抗@测试频率:220Ω@100MHz;误差:±25%;直流电阻(RDC):50mΩ;; Manufacturer: muRata(村田); AddInBom: yes; ModelId: 2bc5ec593d464d6ba9807aec0b5673c2; ModelName: L0603_L1.6-W0.8-H0.5_BEAD; ModelTransform: 62.992,31.496,0,180,0,0,0.094,0.629,0; Tolerance: ±25%; DC Resistance: 50mΩ; Current Rating: 2.2A; Circuits: 1; Symbol: BLM18KG221SN1D; Device: BLM18KG221SN1D; LCSC Part Name: 单路 0603磁珠 阻抗220Ω@100MHz; SupplierPart: C88980; ManufacturerPart: BLM18KG221SN1D; Supplier Footprint: 0603; JLCPCB Part Class: 扩展库; Datasheet: https://atta.szlcsc.com/upload/public/pdf/source/20180326/C88980_2C536F2328F49D4DFD71B8DED243E2BA.pdf; Supplier: LCSC; ConvertToPcb: yes; FootprintName: L0603; Impedance @ Frequency: 220Ω@100MHz
LED1 = NCD0603W1: 发光颜色:白灯;; Manufacturer: 国星光电; Symbol: FC-D1608WD-460H5; AddInBom: yes; ModelId: 1f0d29a91be547639d425604e9b96ebb; ModelTransform: 63.7794,32.283,0,0,0,0,0,0,0; Emitted Color: 白灯; Device: NCD0603W1; LCSC Part Name: NCD0603W1; SupplierPart: C84265; ManufacturerPart: NCD0603W1; Supplier Footprint: 0603; JLCPCB Part Class: 扩展库; Datasheet: https://atta.szlcsc.com/upload/public/pdf/source/20200820/C84265_479E6193713348A548E5CD6D9278BF16.pdf; Supplier: LCSC; ConvertToPcb: yes; FootprintName: LED0603-RD; ModelName: LED0603-RD
R1 = 0402WGF1802TCE: 电阻类型:厚膜电阻;阻值:18kΩ;精度:±1%;功率:62.5mW;; Manufacturer: UNI-ROYAL(厚声); Symbol: 18k; Convert to PCB: yes; ModelId: 671aefced39d4c318694bba8bd8efd39; ModelName: R0402_L1.0-W0.5-H0.5; ModelTransform: 39.37,19.685,0,0,0,0,0,0.0005,0; Tolerance: ±1%; Power(Watts): 62.5mW; Temperature Coefficient: ±100ppm/℃; Overload Voltage (Max): 50V; Origin Footprint: R0402; Device: 0402WGF1802TCE; Supplier Part: C25762; Supplier: LCSC; Manufacturer Part: 0402WGF1802TCE; Add into BOM: yes; LCSC Part Name: 18kΩ ±1% 62.5mW; Supplier Footprint: 0402; JLCPCB Part Class: Basic Part; Datasheet: https://atta.szlcsc.com/upload/public/pdf/source/20200306/C422600_1E6D84923E4A46A82E41ADD87F860B5C.pdf; FootprintName: R0402; Type: 厚膜电阻; Value: 18kΩ; Operating Temperature Range: -55℃~+155℃
R2 = 0402WGF1002TCE: 电阻类型:厚膜电阻;阻值:10kΩ;精度:±1%;功率:62.5mW;; Manufacturer: UNI-ROYAL(厚声); Symbol: 10k; Convert to PCB: yes; ModelId: 671aefced39d4c318694bba8bd8efd39; ModelName: R0402_L1.0-W0.5-H0.5; ModelTransform: 39.37,19.685,0,0,0,0,0,0.0005,0; Tolerance: ±1%; Power(Watts): 62.5mW; Temperature Coefficient: ±100ppm/℃; Overload Voltage (Max): 50V; Origin Footprint: R0402; Device: 0402WGF1002TCE; Supplier Part: C25744; Supplier: LCSC; Manufacturer Part: 0402WGF1002TCE; Add into BOM: yes; LCSC Part Name: 10kΩ ±1% 62.5mW; Supplier Footprint: 0402; JLCPCB Part Class: Basic Part; Datasheet: https://atta.szlcsc.com/upload/public/pdf/source/20200306/C422600_1E6D84923E4A46A82E41ADD87F860B5C.pdf; FootprintName: R0402; Type: 厚膜电阻; Value: 10kΩ; Operating Temperature Range: -55℃~+155℃
R3 R4 = 0402WGF2001TCE: 电阻类型:厚膜电阻;阻值:2kΩ;精度:±1%;功率:62.5mW;; Manufacturer: UNI-ROYAL(厚声); Symbol: 2k; Convert to PCB: yes; ModelId: 671aefced39d4c318694bba8bd8efd39; ModelName: R0402_L1.0-W0.5-H0.5; ModelTransform: 39.37,19.685,0,0,0,0,0,0.0005,0; Tolerance: ±1%; Power(Watts): 62.5mW; Temperature Coefficient: ±100ppm/℃; Overload Voltage (Max): 50V; Origin Footprint: R0402; Device: 0402WGF2001TCE; Supplier Part: C4109; Supplier: LCSC; Manufacturer Part: 0402WGF2001TCE; Add into BOM: yes; LCSC Part Name: 2kΩ ±1% 62.5mW; Supplier Footprint: 0402; JLCPCB Part Class: Basic Part; Datasheet: https://atta.szlcsc.com/upload/public/pdf/source/20200306/C422600_1E6D84923E4A46A82E41ADD87F860B5C.pdf; FootprintName: R0402; Type: 厚膜电阻; Value: 2kΩ; Operating Temperature Range: -55℃~+155℃
R5 R6 = RS-06000JT: 阻值:0Ω;精度:±5%;功率:250mW;; Manufacturer: FH(风华); AddInBom: yes; ModelId: 89a1f13db2384da588040e0b3c55bf66; ModelName: R1206_L3.2-W1.6-H0.6; ModelTransform: 125.984,62.992,0,0,0,0,0,0,0; Tolerance: ±5%; Power(Watts): 250mW; Overload Voltage (Max): 200V; Symbol: RS-06000JT; Device: RS-06000JT; LCSC Part Name: 0Ω ±5% 250mW; SupplierPart: C115323; ManufacturerPart: RS-06000JT; Supplier Footprint: 1206; JLCPCB Part Class: 扩展库; Datasheet: https://atta.szlcsc.com/upload/public/pdf/source/20170628/1498638561272.pdf; Supplier: LCSC; ConvertToPcb: yes; FootprintName: R1206; Value: 0Ω; Operating Temperature Range: -55℃~+155℃
R7 = RC0402FR-072K49L: 电阻类型:厚膜电阻;阻值:2.49kΩ;精度:±1%;功率:62.5mW;; Manufacturer: YAGEO(国巨); AddInBom: yes; ModelId: 671aefced39d4c318694bba8bd8efd39; ModelName: R0402_L1.0-W0.5-H0.5; ModelTransform: 39.37,19.685,0,0,0,0,0,0.0005,0; Tolerance: ±1%; Power(Watts): 62.5mW; Temperature Coefficient: ±100ppm/℃; Overload Voltage (Max): 50V; Symbol: RC0402FR-072K49L; Device: RC0402FR-072K49L; LCSC Part Name: 厚膜电阻 2.49kΩ ±1% 62.5mW; SupplierPart: C145071; ManufacturerPart: RC0402FR-072K49L; Supplier Footprint: 0402; JLCPCB Part Class: 扩展库; Datasheet: https://atta.szlcsc.com/upload/public/pdf/source/20171221/C145071_15138311814201195405.pdf; Supplier: LCSC; ConvertToPcb: yes; FootprintName: R0402; Type: 厚膜电阻; Value: 2.49kΩ; Operating Temperature Range: -55℃~+155℃
R8 = 0603WAF1500T5E: 电阻类型:厚膜电阻;阻值:150Ω;精度:±1%;功率:100mW;; Manufacturer: UNI-ROYAL(厚声); AddInBom: yes; ModelId: fc143cca1e79419f9cd78b61e9279f08; ModelTransform: 31.8897,63.7794,0,90,0,0,0,0,0; Tolerance: ±1%; Power(Watts): 100mW; Temperature Coefficient: ±100ppm/℃; Overload Voltage (Max): 75V; Symbol: 0603WAF1500T5E; Device: 0603WAF1500T5E; LCSC Part Name: 150Ω ±1% 100mW; SupplierPart: C22808; ManufacturerPart: 0603WAF1500T5E; Supplier Footprint: 0603; JLCPCB Part Class: 基础库; Datasheet: https://atta.szlcsc.com/upload/public/pdf/source/20200306/C422600_1E6D84923E4A46A82E41ADD87F860B5C.pdf; Supplier: LCSC; ConvertToPcb: yes; FootprintName: R0603; ModelName: R0603; Type: 厚膜电阻; Value: 150Ω; Operating Temperature Range: -55℃~+155℃
R9 R10 = 0603WAF5101T5E: 电阻类型:厚膜电阻;阻值:5.1kΩ;精度:±1%;功率:100mW;; Manufacturer: UNI-ROYAL(厚声); AddInBom: yes; ModelId: fc143cca1e79419f9cd78b61e9279f08; ModelTransform: 31.8897,63.7794,0,90,0,0,0,0,0; Tolerance: ±1%; Power(Watts): 100mW; Temperature Coefficient: ±100ppm/℃; Overload Voltage (Max): 75V; Symbol: 0603WAF5101T5E; Device: 0603WAF5101T5E; LCSC Part Name: 5.1kΩ ±1% 100mW; SupplierPart: C23186; ManufacturerPart: 0603WAF5101T5E; Supplier Footprint: 0603; JLCPCB Part Class: 基础库; Datasheet: https://atta.szlcsc.com/upload/public/pdf/source/20200306/C422600_1E6D84923E4A46A82E41ADD87F860B5C.pdf; Supplier: LCSC; ConvertToPcb: yes; FootprintName: R0603; ModelName: R0603; Type: 厚膜电阻; Value: 5.1kΩ; Operating Temperature Range: -55℃~+155℃
R11-R14 = 0603WAF4701T5E: 电阻类型:厚膜电阻;阻值:4.7kΩ;精度:±1%;功率:100mW;; Manufacturer: UNI-ROYAL(厚声); AddInBom: yes; ModelId: fc143cca1e79419f9cd78b61e9279f08; ModelTransform: 31.8897,63.7794,0,90,0,0,0,0,0; Tolerance: ±1%; Power(Watts): 100mW; Temperature Coefficient: ±100ppm/℃; Overload Voltage (Max): 75V; Symbol: 0603WAF4701T5E; Device: 0603WAF4701T5E; LCSC Part Name: 4.7kΩ ±1% 100mW; SupplierPart: C23162; ManufacturerPart: 0603WAF4701T5E; Supplier Footprint: 0603; JLCPCB Part Class: 基础库; Datasheet: https://atta.szlcsc.com/upload/public/pdf/source/20200306/C422600_1E6D84923E4A46A82E41ADD87F860B5C.pdf; Supplier: LCSC; ConvertToPcb: yes; FootprintName: R0603; ModelName: R0603; Type: 厚膜电阻; Value: 4.7kΩ; Operating Temperature Range: -55℃~+155℃
TP1-TP16 = Test-Point: Test Point 测试点; Check: false; AddInBom: yes; Device: Test-Point; ConvertToPcb: yes; SymbolName: Test-Point; FootprintName: Test-Point-0.5mm
U1 = MT2492: 功能类型:降压型;同步整流:-;输出通道数:-;拓扑结构:-;输入电压:-;输出电流(最大值):-;开关频率:-;; Manufacturer: 西安航天民芯; Origin Footprint: SOT-23-6_L2.9-W1.6-P0.95-LS2.8-BR; Convert to PCB: yes; ModelId: 18da8f6c14a34920b3e136b5c401a119; ModelName: SOT-23-6_L2.9-W1.6-H1.5-LS2.8-P0.95; ModelTransform: 110.236,113.364,0,90,0,0,0.0005,0.0005,0; Function: 降压型; Device: MT2492; Symbol: MT2492; Supplier: LCSC; Manufacturer Part: MT2492; Supplier Part: C89358; JLCPCB Part Class: Extended Part; Add into BOM: yes; LCSC Part Name: 降压型; Supplier Footprint: SOT-23-6; Datasheet: https://atta.szlcsc.com/upload/public/pdf/source/20221209/5C81DA9662873D3A116170FFBF63E49D.pdf; FootprintName: SOT-23-6_L2.9-W1.6-P0.95-LS2.8-BL; Synchronous Rectification: -; Number of Outputs: -; Topology: -; Input Voltage: -; Output Current (Max): -; Switching Frequency: -
U2 = RTL8367S-CG: 应用功能:-;通道数:-;接口类型:-;; Manufacturer: REALTEK(瑞昱); AddInBom: yes; ModelId: 5babc6b53ea94e89b04e169fdd4a49fc; ModelName: LQFP-128_L14.0-W14.0-H1.6-P0.40-LS16.0-BL; ModelTransform: 629.92,629.92,0,0,0,0,0,0,0; JLCPCB Part Class: Extended Part; Manufacturer Part: RTL8367S-CG; Symbol: RTL8367S-CG; Device: RTL8367S-CG; LCSC Part Name: 二层管理5+2端口10/100/1000M交换机控制器; SupplierPart: C2760849; Supplier Footprint: LQFP-128(14x14); Supplier: LCSC; ConvertToPcb: yes; FootprintName: LQFP-128_L14.0-W14.0-P0.40-LS16.0-BL; Application Function: -; Number of Channels: -; Interface: -
USB1 = TYPE-C 6P(040新): 连接器类型:Type-C;标准:-;公母:母座;触点数量:6P;端口数量:1;安装方式:卧贴;额定电流 - 电源:3A;工作温度范围:-40℃~+85℃;; Manufacturer: SHOU HAN(首韩); AddInBom: yes; ModelId: fb1418f8b16e47cdb24a4fea470b26a0; ModelTransform: 351.9678,267.716,0,0,0,0,0,-43.189,-39.37; Gender: 母座; Number of Ports: 1; Current Rating - Power (Max): 3A; Symbol: TYPE-C 6P(040新); Device: TYPE-C 6P(040新); Supplier: LCSC; Supplier Part: C2887422; Manufacturer Part: TYPE-C 6P(040新); JLCPCB Part Class: 扩展库; LCSC Part Name: Type-C 母座 卧贴 外壳带丝印; Supplier Footprint: SMD; Datasheet: https://atta.szlcsc.com/upload/public/pdf/source/20210820/A6D4675B44FEA528A0512D7C06DEA92E.pdf; ConvertToPcb: yes; FootprintName: USB-C-SMD_TYPE-C-6P; ModelName: USB-C-SMD_TYPE-C-6P; Connector Type: Type-C; Standard: -; Number of Contacts: 6P; Mounting Style: 卧贴; Operating Temperature Range: -40℃~+85℃
X1 = XRCGB25M000F3M00R0: 频率:-;负载电容:-;; Manufacturer: muRata(村田); AddInBom: yes; ModelId: f3b4f8e0e54d4eeba06711a6736f6dd5; ModelName: OSC-SMD_4P-L2.0-W1.6-H0.8; ModelTransform: 78.74,62.992,0,0,0,0,0,0,0; JLCPCB Part Class: Extended Part; Supplier Part: C127893; Value: -; Symbol: XRCGB25M000F3M00R0; Device: XRCGB25M000F3M00R0; LCSC Part Name: XRCGB25M000F3M00R0; ManufacturerPart: XRCGB25M000F3M00R0; Supplier Footprint: SMD2016-4P; Datasheet: https://atta.szlcsc.com/upload/public/pdf/source/20170914/C127893_1505359425389967708.pdf; Supplier: LCSC; ConvertToPcb: yes; FootprintName: CRYSTAL-SMD_4P-L2.0-W1.6-BL; Crystal Type: -; Load Capacitance: -; Operating Temperature: -